# Altium schematic sheet filters.SchDoc
size B; SheetNumber: 1; SheetTotal: 1
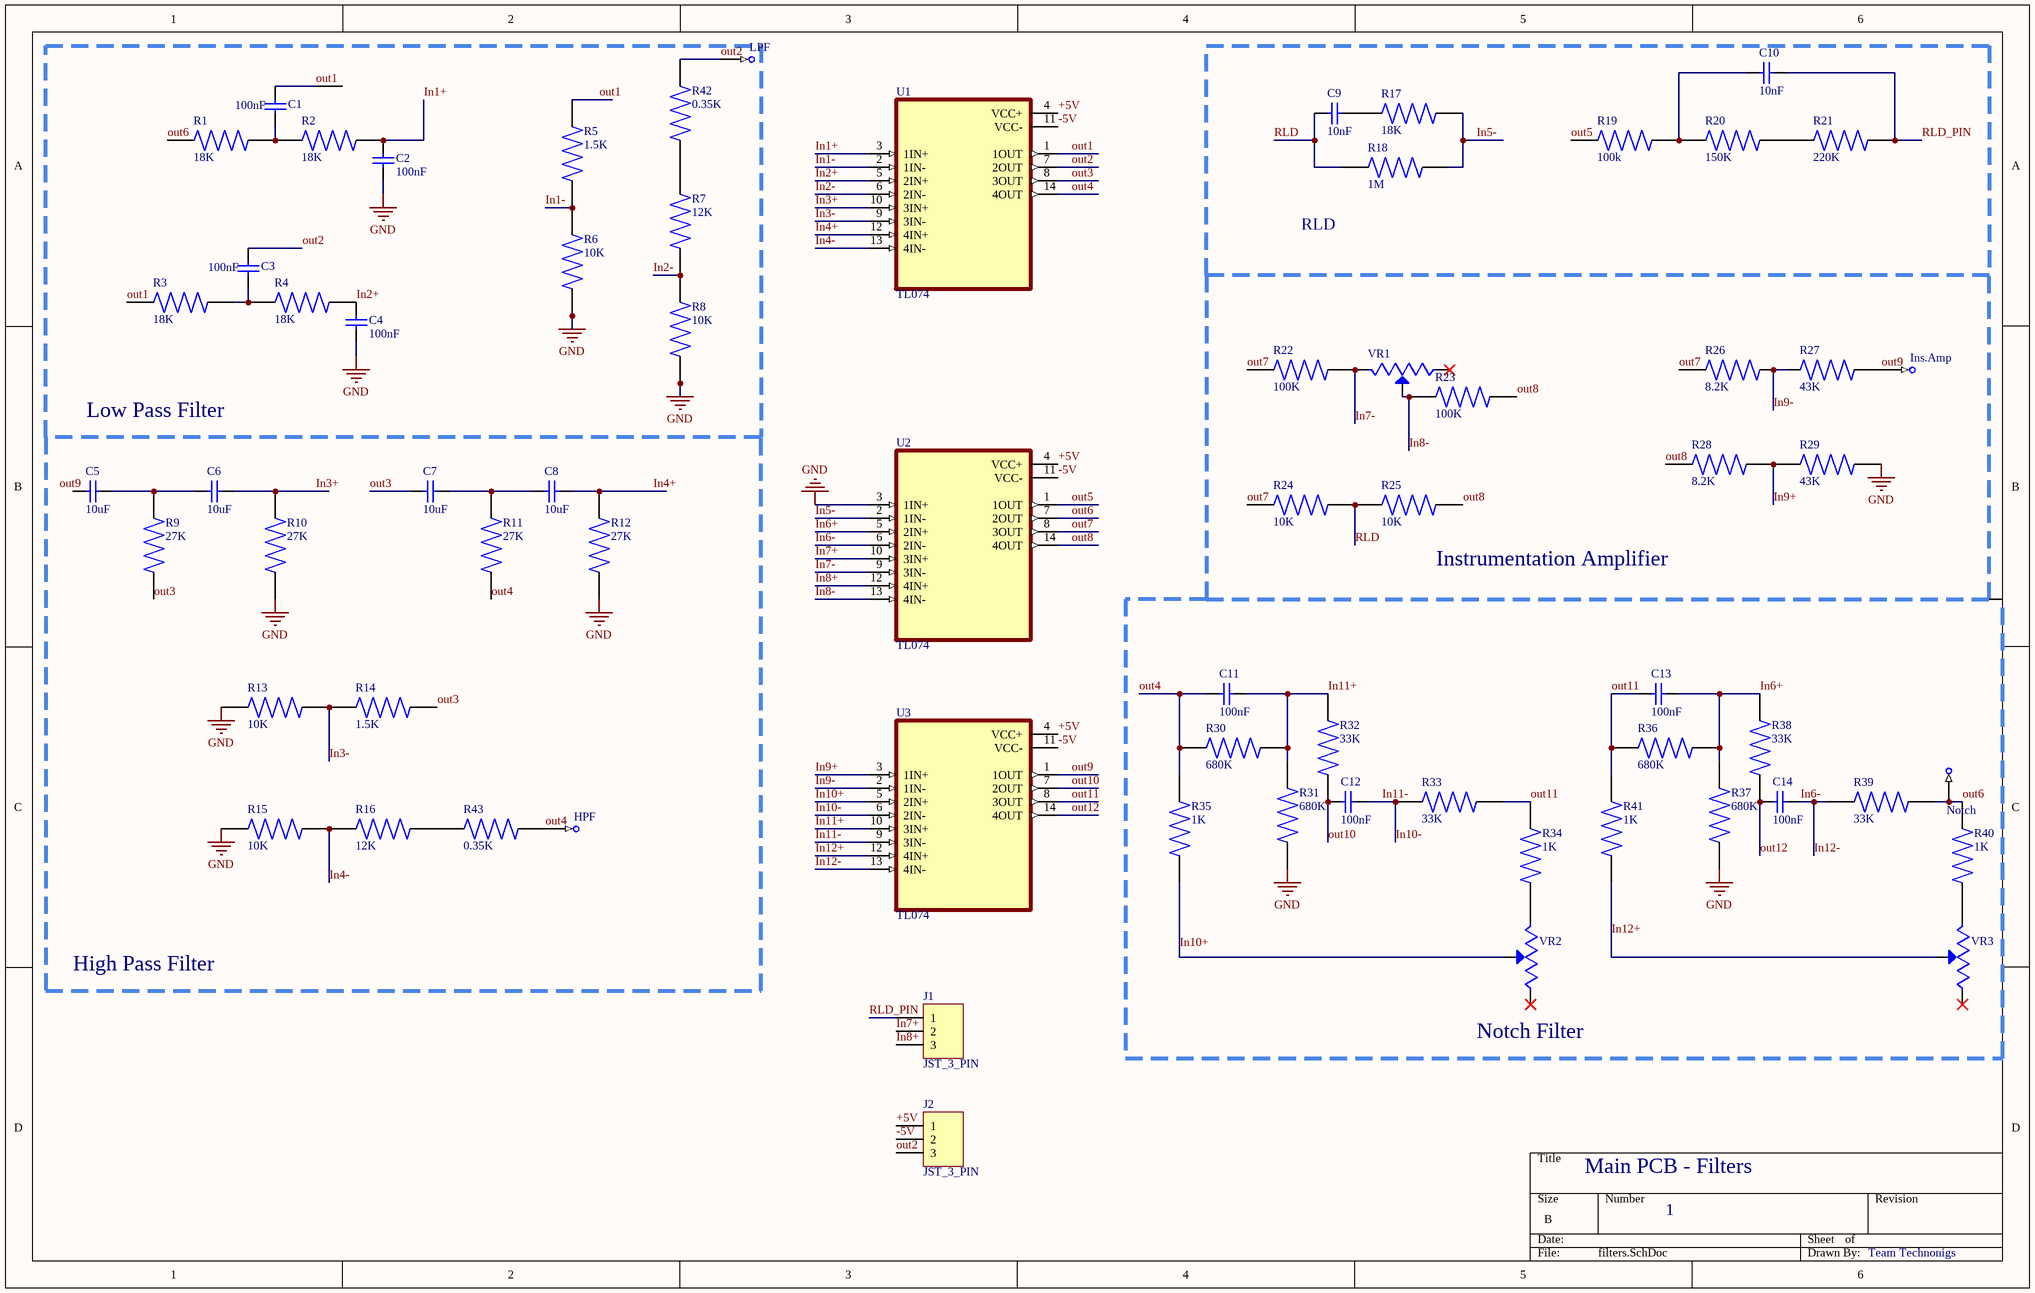
[diagram p0: filters.SchDoc]

## Parts
C1  100nF  [CAPC2012X145N]
C2  100nF  [CAPC2012X145N]
C3  100nF  [CAPC2012X145N]
C4  100nF  [CAPC2012X145N]
C5  10uF  [CAPC2012X145N]
C6  10uF  [CAPC2012X145N]
C7  10uF  [CAPC2012X145N]
C8  10uF  [CAPC2012X145N]
C9  10nF  [CAPC2012X145N]
C10  10nF  [CAPC2012X145N]
C11  100nF  [CAPC2012X145N]
C12  100nF  [CAPC2012X145N]
C13  100nF  [CAPC2012X145N]
C14  100nF  [CAPC2012X145N]
HPF  net?  [MY_TestPin]  (value not drawn)  (no BOM)
Ins.Amp  net?  [MY_TestPin]  (value not drawn)  (no BOM)
J1  JST_3_PIN  [JST_3_Pin]
J2  JST_3_PIN  [JST_3_Pin]
LPF  net?  [MY_TestPin]  (value not drawn)  (no BOM)
Notch  net?  [MY_TestPin]  (value not drawn)  (no BOM)
R1  18K  [RESC2012X65N]
R2  18K  [RESC2012X65N]
R3  18K  [RESC2012X65N]
R4  18K  [RESC2012X65N]
R5  1.5K  [RESC2012X60N]
R6  10K  [RESC2012X60N]
R7  12K  [RESC2012X60N]
R8  10K  [RESC2012X60N]
R9  27K  [RESC2012X65N]
R10  27K  [RESC2012X65N]
R11  27K  [RESC2012X65N]
R12  27K  [RESC2012X65N]
R13  10K  [RESC2012X65N]
R14  1.5K  [RESC2012X65N]
R15  10K  [RESC2012X65N]
R16  12K  [RESC2012X65N]
R17  18K  [RESC2012X65N]
R18  1M  [RESC2012X65N]
R19  100k  [RESC2012X65N]
R20  150K  [RESC2012X65N]
R21  220K  [RESC2012X65N]
R22  100K  [RESC2012X65N]
R23  100K  [RESC2012X60N]
R24  10K  [RESC2012X60N]
R25  10K  [RESC2012X60N]
R26  8.2K  [RESC2012X60N]
R27  43K  [RESC2012X60N]
R28  8.2K  [RESC2012X60N]
R29  43K  [RESC2012X60N]
R30  680K  [RESC2012X60N]
R31  680K  [RESC2012X60N]
R32  33K  [RESC2012X60N]
R33  33K  [RESC2012X60N]
R34  1K  [RESC2012X60N]
R35  1K  [RESC2012X60N]
R36  680K  [RESC2012X60N]
R37  680K  [RESC2012X60N]
R38  33K  [RESC2012X60N]
R39  33K  [RESC2012X60N]
R40  1K  [RESC2012X60N]
R41  1K  [RESC2012X60N]
R42  0.35K  [RESC2012X60N]
R43  0.35K  [RESC2012X65N]
U1  TL074  [TL074CN]
U2  TL074  [TL074CN]
U3  TL074  [TL074CN]
VR1  3296W-1-103LF  [TRIM_3296W-1-103LF]  (value not drawn)
VR2  3296W-1-103LF  [TRIM_3296W-1-103LF]  (value not drawn)
VR3  3296W-1-103LF  [TRIM_3296W-1-103LF]  (value not drawn)

## Blocks framed on the sheet
Low Pass Filter: C1-C4 LPF R1-R8 R42
RLD: C9 C10 R17-R21
High Pass Filter: C5-C8 HPF R9-R16 R43

## Nets
GND: C2.1 C4.1 R6.1 R8.1 R10.1 R12.1 R13.2 R15.2 R29.2 R31.1 R37.2 U2.3(1IN+)
+5V: J2.1 U1.4(VCC+) U2.4(VCC+) U3.4(VCC+)
-5V: J2.2 U1.11(VCC-) U2.11(VCC-) U3.11(VCC-)
In1+: C2.2 R2.2 U1.3(1IN+)
In1-: R5.1 R6.2 U1.2(1IN-)
In2+: C4.2 R4.2 U1.5(2IN+)
In2-: R7.1 R8.2 U1.6(2IN-)
In3+: C6.1 R10.2 U1.10(3IN+)
In3-: R13.1 R14.2 U1.9(3IN-)
In4+: C8.1 R12.2 U1.12(4IN+)
In4-: R15.1 R16.2 U1.13(4IN-)
In5-: R17.2 R18.2 U2.2(1IN-)
In6+: C13.1 R36.1 R37.1 R38.1 U2.5(2IN+)
In7+: J1.2 U2.10(3IN+)
In7-: R22.2 U2.9(3IN-) VR1.3(CW)
In8+: J1.3 U2.12(4IN+)
In8-: R23.1 U2.13(4IN-) VR1.2(WIPER)
In9+: R28.2 R29.1 U3.3(1IN+)
In9-: R26.2 R27.1 U3.2(1IN-)
In10+: R35.1 U3.5(2IN+) VR2.2(WIPER)
In10-: C12.1 R33.2 U3.6(2IN-) U3.9(3IN-)  [also labelled In11-]
In11+: C11.1 R30.2 R31.2 R32.2 U3.10(3IN+)
In12+: R41.2 U3.12(4IN+) VR3.2(WIPER)
In12-: C14.1 R39.1 U2.6(2IN-) U3.13(4IN-)  [also labelled In6-]
out1: C1.2 R3.1 R5.2 U1.1(1OUT)
out2: C3.2 J2.3 LPF.1 R42.2 U1.7(2OUT)
out3: C7.2 R9.1 R14.1 U1.8(3OUT)
out4: C11.2 HPF.1 R11.1 R30.1 R35.2 R43.1 U1.14(4OUT)
out5: R19.1 U2.1(1OUT)
out6: Notch.1 R1.1 R39.2 R40.1 U2.7(2OUT)
out7: R22.1 R24.1 R26.1 U2.8(3OUT)
out8: R23.2 R25.2 R28.1 U2.14(4OUT)
out9: Ins.Amp.1 R27.2 U3.1(1OUT)
out10: C12.2 R32.1 U3.7(2OUT)
out11: C13.2 R33.1 R34.2 R36.2 R41.1 U3.8(3OUT)
out12: C14.2 R38.2 U3.14(4OUT)
RLD: C9.2 R18.1 R24.2 R25.1
RLD_PIN: C10.1 J1.1 R21.2
NetC1_1: C1.1 R1.2 R2.1
NetC3_1: C3.1 R3.2 R4.1
NetC5_1: C5.1 C6.2 R9.2
NetC7_1: C7.1 C8.2 R11.2
NetC9_1: C9.1 R17.1
NetC10_2: C10.2 R19.2 R20.1
NetR7_2: R7.2 R42.1
NetR16_1: R16.1 R43.2
NetR20_2: R20.2 R21.1
NetR34_1: R34.1 VR2.3(CW)
NetR40_2: R40.2 VR3.3(CW)

Not connected (* = marked no-connect by the designer): C5 2; VR1 1(CCW)*; VR2 1(CCW)*; VR3 1(CCW)*

## Notes on the sheet
- (near R25) Instrumentation Amplifier
- (near VR2) Notch Filter
- Main PCB - Filters
- 1
- Team Technonigs
- Labels drawn without touching a wire or pin: out9

## Library data of the parts
C1-C14 = Capacitor_SMD
HPF Ins.Amp LPF Notch = Test Point: ASiD Part Number: Test Point-AS
R1-R4 R9-R22 R43 = 0805W8F1802T5E: 18K Ohm 1/8W Thick Film Resistor 0805 Chip - Surface Mount; MF: Uni-Royal; SnapEDA_Link: https://www.snapeda.com/parts/0805W8F1802T5E/Uni-Royal/view-part/?ref=snap; Package: 0805-2 ROYAL; Value: *; MP: 0805W8F1802T5E; Check_prices: https://www.snapeda.com/parts/0805W8F1802T5E/Uni-Royal/view-part/?ref=eda
R5-R8 R23-R42 = Resistor SMD: Res Thin Film 0805 18K Ohm 0.1% 0.125W(1/8W) Â±25ppm/C Epoxy Pad SMD T/R; MF: Yageo; MP: RT0805BRD0718KL; SnapEDA_Link: https://www.snapeda.com/parts/RT0805BRD0718KL/Yageo/view-part/?ref=snap; Package: 2012 Yageo; Value: *; Check_prices: https://www.snapeda.com/parts/RT0805BRD0718KL/Yageo/view-part/?ref=eda
VR1-VR3 = 3296W-1-103LF: Trimmer, Cermet, Rest 10 Kilohms, PCB, 25 Turns, Pwr-Rtg 0.5W, 3296 Series | Bourns 3296W-1-103LF; SnapEDA_Link: https://www.snapeda.com/parts/3296W-1-103LF/Bourns/view-part/?ref=snap; Package: NON STANDARD-3 Bourns; Value: *; MF: Bourns; MP: 3296W-1-103LF; Check_prices: https://www.snapeda.com/parts/3296W-1-103LF/Bourns/view-part/?ref=eda; ComponentLink1Description: Datasheet; ComponentLink1URL: https://www.lcsc.com/datasheet/C34846.pdf?spm=wm.sxq.inf.ggs___wm.fly.bg.0.xh&lcsc_vid=E1ENX1FRElJeVAFTE1MMBlZSQFBcBFNRE1VXU1xfE1MxVlNeTldaVlFTQlBdUjsOAxUeFF5JWBYZEEoKFBINSQcJGk4%3D
U1-U3 = TL074: ComponentLink1Description: Data sheet; ComponentLink1URL: https://www.alldatasheet.com/datasheet-pdf/view/28778/TI/TL074.html